# Altium schematic sheet KIT_ARDUINO_BLK_R00.SchDoc: KIT ARDUINO 2022
size A4; Author: Valeria Bank; CompanyName: Sistemas De Representacion; Revision: R00; SheetNumber: 1; SheetTotal: 4
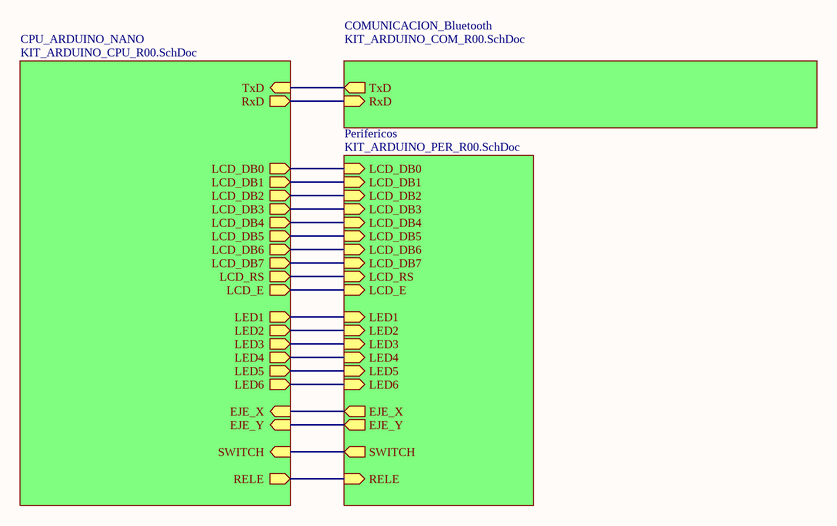
[diagram p0: KIT_ARDUINO_BLK_R00.SchDoc]

## Sub-sheets
COMUNICACION_Bluetooth = KIT_ARDUINO_COM_R00.SchDoc: TxD (out), RxD (in)
CPU_ARDUINO_NANO = KIT_ARDUINO_CPU_R00.SchDoc: TxD (in), RxD (out), LCD_DB0 (out), LCD_DB1 (out), LCD_DB2 (out), LCD_DB3 (out), LCD_DB4 (out), LCD_DB5 (out), LCD_DB6 (out), LCD_DB7 (out), LCD_RS (out), LCD_E (out), LED2 (out), LED3 (out), LED4 (out), EJE_X (in), EJE_Y (in), LED1 (out), SWITCH (in), RELE (out), LED5 (out), LED6 (out)
Perifericos = KIT_ARDUINO_PER_R00.SchDoc: LCD_DB0 (in), LCD_DB1 (in), LCD_DB2 (in), LCD_DB3 (in), LCD_DB4 (in), LCD_DB5 (in), LCD_DB6 (in), LCD_DB7 (in), LCD_RS (in), LCD_E (in), LED1 (in), LED2 (in), LED3 (in), LED4 (in), EJE_X (out), EJE_Y (out), SWITCH (out), RELE (in), LED5 (in), LED6 (in)

## Nets
(unnamed): sheet CPU_ARDUINO_NANO/TxD, sheet COMUNICACION_Bluetooth/TxD
(unnamed): sheet CPU_ARDUINO_NANO/RxD, sheet COMUNICACION_Bluetooth/RxD
(unnamed): sheet CPU_ARDUINO_NANO/LCD_DB0, sheet Perifericos/LCD_DB0
(unnamed): sheet CPU_ARDUINO_NANO/LCD_DB1, sheet Perifericos/LCD_DB1
(unnamed): sheet CPU_ARDUINO_NANO/LCD_DB2, sheet Perifericos/LCD_DB2
(unnamed): sheet CPU_ARDUINO_NANO/LCD_DB3, sheet Perifericos/LCD_DB3
(unnamed): sheet CPU_ARDUINO_NANO/LCD_DB4, sheet Perifericos/LCD_DB4
(unnamed): sheet CPU_ARDUINO_NANO/LCD_DB5, sheet Perifericos/LCD_DB5
(unnamed): sheet CPU_ARDUINO_NANO/LCD_DB6, sheet Perifericos/LCD_DB6
(unnamed): sheet CPU_ARDUINO_NANO/LCD_DB7, sheet Perifericos/LCD_DB7
(unnamed): sheet CPU_ARDUINO_NANO/LCD_RS, sheet Perifericos/LCD_RS
(unnamed): sheet CPU_ARDUINO_NANO/LCD_E, sheet Perifericos/LCD_E
(unnamed): sheet CPU_ARDUINO_NANO/LED2, sheet Perifericos/LED2
(unnamed): sheet CPU_ARDUINO_NANO/LED3, sheet Perifericos/LED3
(unnamed): sheet CPU_ARDUINO_NANO/LED4, sheet Perifericos/LED4
(unnamed): sheet CPU_ARDUINO_NANO/EJE_X, sheet Perifericos/EJE_X
(unnamed): sheet CPU_ARDUINO_NANO/EJE_Y, sheet Perifericos/EJE_Y
(unnamed): sheet CPU_ARDUINO_NANO/LED1, sheet Perifericos/LED1
(unnamed): sheet CPU_ARDUINO_NANO/SWITCH, sheet Perifericos/SWITCH
(unnamed): sheet CPU_ARDUINO_NANO/RELE, sheet Perifericos/RELE
(unnamed): sheet CPU_ARDUINO_NANO/LED5, sheet Perifericos/LED5
(unnamed): sheet CPU_ARDUINO_NANO/LED6, sheet Perifericos/LED6

## Notes on the sheet
- Title:
- Size:
- Author:
- A4
- Sheet
- of
- Revision:
- File:
- Date: